# EasyEDA Pro project iamdt-guang-chui-60-40a2c53b.epro, board PCB1
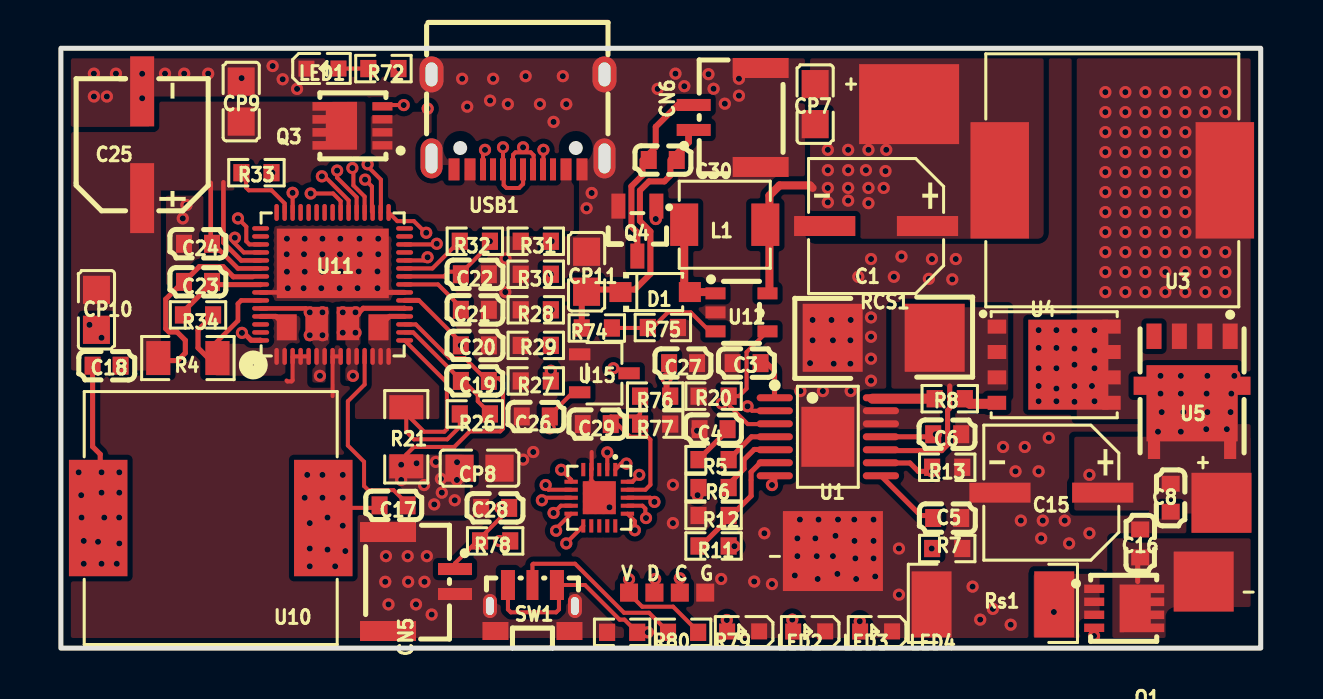
[diagram p3: board, top side]
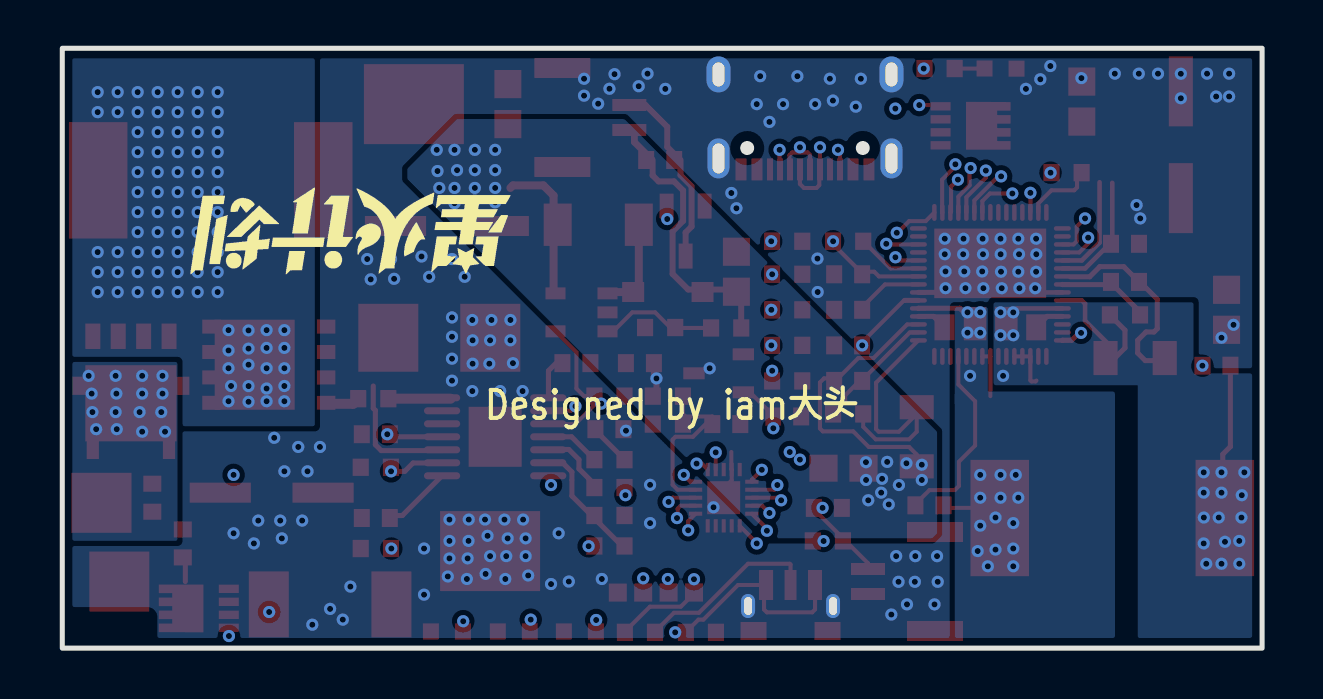
[diagram p4: board, bottom side, seen from below]

Outline 60 x 30 mm; copper layers: Top Layer, Inner1, Inner2, Bottom Layer. Coordinates in mm from the lower left corner of the outline.
Outline path: rectangle 0,30 60,0
Stack: Top Layer 0.035mm 外层铜厚1oz / Dielectric1 0.2104mm 7628 RC49% 8.6mil / Inner1 0.0152mm 内层铜厚 / Dielectric2 1.065mm 1.1mm H/HOZ Copper / Inner2 0.0152mm 内层铜厚 / Dielectric3 0.2104mm 7628 RC49% 8.6mil / Bottom Layer 0.035mm 外层铜厚1oz

## Design rules (mm)
spacing copperThickness1oz (default): track to track 0.102, other pairs 0.152 to 0.3
spacing copperThickness2oz: track to track 0.203, other pairs 0.152 to 0.3
spacing Plane_innerPlane: track to track 0.102, other pairs 0.152 to 0.3
spacing Copper_copperRegion: track to track 0.102, other pairs 0.152 to 0.3
track width copperThickness1oz (default): min 0.127, default 0.254, max 5
track width copperThickness2oz: min 0.203, default 0.254, max 2.54
differential pair differentialPair (default): width min 0.127, default 0.254, max 2.54; gap min 0.152, default 0.152
pour e896 uses Copper_copperRegion
pour e898 uses Copper_copperRegion
pour e900 uses Copper_copperRegion
pour e905 uses Copper_copperRegion
pour e907 uses Copper_copperRegion
pour e909 uses Copper_copperRegion
pour e911 uses Copper_copperRegion
pour e913 uses Copper_copperRegion
pour e915 uses Copper_copperRegion
pour e917 uses Copper_copperRegion
pour e919 uses Copper_copperRegion
pour e921 uses Copper_copperRegion
pour e923 uses Copper_copperRegion
pour e925 uses Copper_copperRegion
pour e927 uses Copper_copperRegion
pour e929 uses Copper_copperRegion
pour e931 uses Copper_copperRegion
pour e933 uses Copper_copperRegion
pour e935 uses Copper_copperRegion
pour e937 uses Copper_copperRegion
pour e939 uses Copper_copperRegion
pour e941 uses Copper_copperRegion
pour e943 uses Copper_copperRegion
pour e945 uses Copper_copperRegion
pour e947 uses Copper_copperRegion
pour e949 uses Copper_copperRegion
pour e951 uses Copper_copperRegion
pour e953 uses Copper_copperRegion
pour e955 uses Copper_copperRegion

## Placement (name value [footprint] x y rotation side)
C  -  [Test-Point-0.5mm]  31.2 2.81 0 top
C1  220uF  [CAP-SMD_BD6.3-L6.6-W6.6-LS7.0-FD]  40.77 21.11 180 top
C3  10uF  [C0603]  34.29 14.25 0 top
C4  1nF  [C0603]  32.64 10.95 0 top
C5  100nF  [C0603]  44.32 6.5 180 top
C6  100nF  [C0603]  44.32 10.7 0 top
C8  100nF  [C0603]  55.5 7.52 90 top
C15  220uF  [CAP-SMD_BD6.3-L6.6-W6.6-LS7.0-FD]  49.53 7.78 180 top
C16  2.2uF  [C0603]  53.98 5.23 270 top
C17  100nF  [C0603]  16.64 7.14 180 top
C18  100nF  [C0603]  2.29 14.12 180 top
C19  1uF  [C0603]  20.7 13.36 0 top
C20  2.2uF  [C0603]  20.7 15.14 180 top
C21  2.2uF  [C0603]  20.7 16.92 180 top
C22  2.2uF  [C0603]  20.7 18.7 180 top
C23  470nF  [C0603]  6.86 18.32 0 top
C24  2.2uF  [C0603]  6.86 20.22 0 top
C25  100uF  [CAP-SMD_BD6.3-L6.5-W6.5-LS7.2-FD]  4.06 25.17 90 top
C26  10uF  [C0603]  23.75 11.59 180 top
C27  10uF  [C0603]  31.11 14.25 0 top
C28  100nF  [C0603]  21.72 7.01 0 top
C29  100nF  [C0603]  26.8 11.2 180 top
C30  10uF  [C0603]  30.1 24.41 180 top
CN5  WAFER-GH1.25-2PLB  [CONN-TH_2P-P1.25_XUNPU_WAFER-GH1.25-2PLB]  18.03 3.33 270 top
CN6  WAFER-GH1.25-2PLB  [CONN-TH_2P-P1.25_XUNPU_WAFER-GH1.25-2PLB]  33.32 26.54 90 top
CP7  22uF  [C0805]  37.72 27.21 90 top
CP8  22uF  [C0805]  20.93 9 180 top
CP9  22uF  [C0805]  9.02 27.33 270 top
CP10  22uF  [C0805]  1.78 16.92 90 top
CP11  22uF  [C0805]  26.29 18.82 270 top
D  -  [Test-Point-0.5mm#3]  29.95 2.54 0 top
D1  B5819W  [SOD-123F_L2.7-W1.6-LS3.8-RD-1]  29.72 17.81 0 top
G  -  [Test-Point-0.5mm#2]  30.81 2.82 0 top
L1  10uH  [IND-SMD_L4.4-W4.2]  33.2 21.17 0 top
LED1  XL-1608UWC-04  [LED0603-RD_WHITE]  13.08 28.98 0 top
LED2  XL-1608UWC-04  [LED0603-RD_WHITE]  34.12 0.83 180 top
LED3  XL-1608UWC-04  [LED0603-RD_WHITE]  37.42 0.83 180 top
LED4  XL-1608UWC-04  [LED0603-RD_WHITE]  40.77 0.83 180 top
NOREF  -  [Pad_e376]  38.61 4.85 90 top
NOREF#2  -  [Pad_e377]  57.15 3.33 0 top
NOREF#3  -  [Pad_e375]  42.42 27.21 270 top
NOREF#4  -  [Pad_e378]  58.04 7.27 0 top
Q1  AON7422E-MS  [POWERDI3333-8_DMN7022LFGQ-7]  52.7 1.99 270 top
Q3  AON7422E-MS  [POWERDI3333-8_DMN7022LFGQ-7]  15.05 26.12 90 top
Q4  MDD3400  [SOT-23-3_L2.9-W1.5-P1.90-LS2.6-BR]  28.83 20.86 90 top
R4  5mΩ  [R1206]  6.35 14.51 180 top
R5  10kΩ  [R0603]  32.64 9.43 0 top
R6  10kΩ  [R0603]  32.64 8.03 180 top
R7  100kΩ  [R0603]  44.32 4.98 180 top
R8  3Ω  [R0603]  44.45 12.47 0 top
R11  200kΩ  [R0603]  32.64 5.11 0 top
R12  9.1kΩ  [R0603]  32.64 6.63 180 top
R13  200kΩ  [R0603]  44.32 9.05 180 top
R20  100kΩ  [R0603]  32.64 12.6 0 top
R21  5mΩ  [R1206]  17.27 10.57 90 top
R26  10Ω  [R0603]  20.7 11.71 180 top
R27  3.6kΩ  [R0603]  23.75 13.36 180 top
R28  18kΩ  [R0603]  23.75 16.92 180 top
R29  9.1kΩ  [R0603]  23.75 15.14 180 top
R30  10kΩ  [R0603]  23.75 18.7 0 top
R31  10kΩ  [R0603]  23.75 20.35 0 top
R32  10kΩ  [R0603]  20.7 20.35 180 top
R33  10kΩ  [R0603]  9.78 23.78 180 top
R34  51Ω  [R0603]  6.86 16.67 0 top
R72  200Ω  [R0603]  16.13 28.98 0 top
R74  100kΩ  [R0603]  26.8 16.01 180 top
R75  10kΩ  [R0603]  30.1 16.03 180 top
R76  200kΩ  [R0603]  29.72 12.6 180 top
R77  100kΩ  [R0603]  29.72 11.2 0 top
R78  10kΩ  [R0603]  21.72 5.36 180 top
R79  10kΩ  [R0603]  31.11 0.79 180 top
R80  100kΩ  [R0603]  28.07 0.79 180 top
RCS1  4mΩ  [RES-SMD_L6.4-W3.2-A]  41.15 15.52 0 top
Rs1  50mΩ  [RES-SMD_L6.4-W3.2-R2512]  46.61 2.19 0 top
SW1  TS36XL-3.5 180gf 072  [SW-TH_SHOU-HAN_TS36XL-3.5]  23.58 2.01 0 top
U1  FP7209mR-G1  [TSSOP-14_L5.0-W4.4-P0.65-LS6.4-BL-EP]  38.35 10.57 270 top
U3  4.7uH  [IND-SMD_L13.5-W12.8]  52.58 23.4 180 top
U4  AONS36306  [PG-TDSON-8_L5.9-W5.2-P1.27-LS6.2-BL-EP]  49.67 14.17 270 top
U5  MBR2045MFST1G  [SO-8FL_L5.2-W5.8-P1.27-LS6.2-BL-EP]  56.57 12.78 180 top
U10  4.7uH  [IND-SMD_L13.5-W12.8]  7.49 6.5 180 top
U11  IP2369  [QFN-7*7-60-5]  13.59 18.19 0 top
U12  LGS6302B5  [SOT-23-5_L3.0-W1.6-P0.95-LS2.8-BL]  34.04 16.79 270 top
U13  PY32F003F16U6TR  [QFN-20_L3.0-W3.0-P0.40-BL-EP1.7]  26.92 7.52 180 top
U15  HT7333  [SOT-23-3_L2.9-W1.6-P1.90-LS2.8-BR]  27.18 13.74 180 top
USB1  TYPE-C 16PIN 2MD(073)  [USB-C-SMD_TYPE-C-6PIN-2MD-073]  22.86 26.32 180 top
V  -  [Test-Point-0.5mm#4]  28.57 2.78 0 top

## Footprints (pads in the part's own frame, mm; a bottom-side part is the same pattern mirrored in y, then rotated)
C0603
  rect 0.8x0.9 smd: 1(-0.7,0) 2(0.7,0)
C0805
  rect 1.41x1.35 smd: 1(-1,0) 2(1,0)
CAP-SMD_BD6.3-L6.5-W6.5-LS7.2-FD
  rect 3.5x1.2 smd: 1(-2.67,0) 2(2.67,0)
CAP-SMD_BD6.3-L6.6-W6.6-LS7.0-FD
  rect 3.06x1 smd: 1(-2.57,0) 2(2.57,0)
CONN-TH_2P-P1.25_XUNPU_WAFER-GH1.25-2PLB
  rect 0.6x1.7 smd: 1(-0.625,1.675) 2(0.625,1.675)
  rect 1x2.8 smd: 3(2.475,-1.675) 4(-2.475,-1.675)
IND-SMD_L4.4-W4.2
  rect 1.4x2.12 smd: 1(2.028,0) 2(-2.028,0)
IND-SMD_L13.5-W12.8
  rect 2.924x5.82 smd: 1(5.628,0) 2(-5.628,0)
LED0603-RD_WHITE
  rect 0.8x0.8 smd: 1(-0.799,-0.004) 2(0.799,0.004)
Pad_e375
  rect 4x5 smd: 1(0,0)
Pad_e376
  rect 4x5 smd: 2(0,0)
Pad_e377
  rect 3x3 smd: 16(0,0)
Pad_e378
  rect 3x3 smd: 17(0,0)
PG-TDSON-8_L5.9-W5.2-P1.27-LS6.2-BL-EP
  rect 0.7x0.925 smd: 1(-1.905,-2.865) 2(-0.635,-2.865) 3(0.635,-2.865) 4(1.905,-2.865) 5(1.905,2.865) 6(0.635,2.865) 7(-0.635,2.865) 8(-1.905,2.865)
  rect 4.5x4 smd: 9(0.001,0.705)
POWERDI3333-8_DMN7022LFGQ-7
  rect 0.42x1 smd: 1(-0.975,-1.025) 2(-0.325,-1.025) 3(0.325,-1.025) 4(0.975,-1.025)
  custom 2.39x2.23 smd: 5(0.005,1.025)
QFN-7*7-60-5
  oval 0.224x0.85 smd: 1(-2.8,-3.6) 2(-2.4,-3.6) 3(-2,-3.6) 4(-1.6,-3.6) 5(-1.2,-3.6) 6(-0.8,-3.6) 7(-0.4,-3.6) 8(0,-3.6) 9(0.4,-3.6) 10(0.8,-3.6) 11(1.2,-3.6) 12(1.6,-3.6) 13(2,-3.6) 14(2.4,-3.6) 15(2.8,-3.6) 31(2.8,3.6) 32(2.4,3.6) 33(2,3.6) 34(1.6,3.6) 35(1.2,3.6) 36(0.8,3.6) 37(0.4,3.6) 38(0,3.6) 39(-0.4,3.6) 40(-0.8,3.6) 41(-1.2,3.6) 42(-1.6,3.6) 43(-2,3.6) 44(-2.4,3.6) 45(-2.8,3.6)
  oval 0.85x0.224 smd: 16(3.6,-2.8) 17(3.6,-2.4) 18(3.6,-2) 19(3.6,-1.6) 20(3.6,-1.2) 21(3.6,-0.8) 22(3.6,-0.4) 23(3.6,0) 24(3.6,0.4) 25(3.6,0.8) 26(3.6,1.2) 27(3.6,1.6) 28(3.6,2) 29(3.6,2.4) 30(3.6,2.8) 46(-3.6,2.8) 47(-3.6,2.4) 48(-3.6,2) 49(-3.6,1.6) 50(-3.6,1.2) 51(-3.6,0.8) 52(-3.6,0.4) 53(-3.6,0) 54(-3.6,-0.4) 55(-3.6,-0.8) 56(-3.6,-1.2) 57(-3.6,-1.6) 58(-3.6,-2) 59(-3.6,-2.4) 60(-3.6,-2.8)
  rect 1x1.3 smd: 61(-2.293,-2.146) 64(2.295,-2.144)
  rect 1.125x1.672 smd: 62(-0.797,-1.958) 63(0.764,-1.956)
  rect 5.6x3.478 smd: 65(0.006,1.053)
QFN-20_L3.0-W3.0-P0.40-BL-EP1.7
  rect 0.2x0.665 smd: 1(-0.8,-1.407) 2(-0.4,-1.407) 3(0,-1.407) 4(0.4,-1.407) 5(0.8,-1.407) 11(0.8,1.407) 12(0.4,1.407) 13(0,1.407) 14(-0.4,1.407) 15(-0.8,1.407)
  rect 0.665x0.2 smd: 6(1.407,-0.8) 7(1.407,-0.4) 8(1.407,0) 9(1.407,0.4) 10(1.407,0.8) 16(-1.407,0.8) 17(-1.407,0.4) 18(-1.407,0) 19(-1.407,-0.4) 20(-1.407,-0.8)
  rect 1.65x1.65 smd: 21(0,0)
R0603
  rect 0.806x0.864 smd: 1(-0.753,0) 2(0.753,0)
R1206
  rect 1.208x1.701 smd: 1(-1.479,0) 2(1.479,0)
RES-SMD_L6.4-W3.2-A
  rect 3x3.4 smd: 1(-2.55,0) 2(2.55,0)
RES-SMD_L6.4-W3.2-R2512
  rect 2x3.3 smd: 1(-3.067,0) 2(3.067,0)
SO-8FL_L5.2-W5.8-P1.27-LS6.2-BL-EP
  rect 0.75x1.27 smd: 1(-1.905,-2.816) 2(-0.635,-2.816) 3(0.635,-2.816) 4(1.905,-2.816)
  rect 0.61x1.016 smd: 5(1.905,2.816) 6(-1.905,2.816)
  rect 1.016x0.91 smd: 7(2.413,-0.339) 8(-2.413,-0.339)
  rect 4.56x3.81 smd: 8(0,0.537)
SOD-123F_L2.7-W1.6-LS3.8-RD-1
  rect 1.1x1 smd: 1(-1.735,0) 2(1.735,0)
SOT-23-3_L2.9-W1.5-P1.90-LS2.6-BR
  rect 1.25x0.7 smd: 1(1.25,-0.95) 2(1.25,0.95) 3(-1.25,0)
SOT-23-3_L2.9-W1.6-P1.90-LS2.8-BR
  rect 1.07x0.6 smd: 1(1.235,-0.95) 2(1.235,0.95) 3(-1.235,0)
SOT-23-5_L3.0-W1.6-P0.95-LS2.8-BL
  rect 0.6x1 smd: 1(-0.95,-1.3) 2(0,-1.3) 3(0.95,-1.3) 4(0.95,1.3) 5(-0.95,1.3)
SW-TH_SHOU-HAN_TS36XL-3.5
  rect 0.7x1.5 smd: 1(-1.225,1.15) 3(1.225,1.15)
  rect 0.6x1.5 smd: 2(0,1.15)
  rect 1.3x0.9 smd: 4(1.85,-1.15) 5(-1.85,-1.15)
  oval 0.7x1.2 hole 0.4x0.9: 6(2.125,0.1) 7(-2.125,0.1)
Test-Point-0.5mm
  rect 0.9x0.9 smd: 1(-0.252,-0.033)
Test-Point-0.5mm#2
  rect 0.9x0.9 smd: 1(1.415,-0.049)
Test-Point-0.5mm#3
  rect 0.9x0.9 smd: 1(-0.268,0.237)
Test-Point-0.5mm#4
  rect 0.9x0.9 smd: 1(-0.157,0)
TSSOP-14_L5.0-W4.4-P0.65-LS6.4-BL-EP
  oval 0.35x1.809 smd: 1(-1.95,-2.655) 2(-1.3,-2.655) 3(-0.65,-2.655) 4(0,-2.655) 5(0.65,-2.655) 6(1.3,-2.655) 7(1.95,-2.655) 8(1.95,2.655) 9(1.3,2.655) 10(0.65,2.655) 11(0,2.655) 12(-0.65,2.655) 13(-1.3,2.655) 14(-1.95,2.655)
  rect 3x2.65 smd: 15(0,0)
USB-C-SMD_TYPE-C-6PIN-2MD-073
  rect 0.55x1.1 smd: 1(-3.2,2.375) 2(-2.4,2.375) 11(2.4,2.375) 12(3.2,2.375)
  rect 0.3x1.1 smd: 3(-1.75,2.375) 4(-1.25,2.375) 5(-0.75,2.375) 6(-0.25,2.375) 7(0.25,2.375) 8(0.75,2.375) 9(1.25,2.375) 10(1.75,2.375)
  oval 1.1x2 hole 0.6x1.5: 13(-4.325,1.825) 14(4.325,1.825)
  oval 1.2x1.8 hole 0.6x1.2: 13(-4.325,-2.375) 14(4.325,-2.375)

## Nets
As in the schematic, except:
GND: C1.2 C3.1 C4.1 C5.1 C6.2 C8.1 C15.2 C16.1 C20.1 C21.1 C22.1 C24.1 C25.2 C26.2 C27.2 C28.1 C29.2 CN5.2 CN5.3 CN5.4 CN6.3 CN6.4 CP7.1 CP8.1 CP9.1 CP10.1 CP11.1 G.1 LED1.1 LED2.1 LED3.1 LED4.1 NOREF.2 Q4.2 R7.1 R12.2 R13.1 R20.1 R27.2 R28.2 R29.2 R30.1 R31.1 R75.1 R77.2 R80.2 RCS1.1 Rs1.1 SW1.4 SW1.5 SW1.6 SW1.7 U1.12 U1.13 U1.15 U11.3 U11.4 U11.5 U11.8 U11.9 U11.22 U11.54 U11.65 U12.2 U13.4 U13.21 U15.1 USB1.1 USB1.12 USB1.13 USB1.14
VCC: C1.1 C19.2 C20.2 C27.1 CP7.2 CP8.2 L1.1 NOREF#3.1 R21.1 R76.1 U3.1 U11.18 U11.21 U12.5 U15.3
OUT+: C6.1 C8.2 C15.1 NOREF#4.17 R11.2 U1.11 U5.5 U5.6 U5.7 U5.8
OUT-: C16.2 NOREF#2.16 Q1.5

Pads without a net: U5 4; U11 27 29 30 38 39 40 41 42 45 46 47 58 59; U13 3 5 12 13 14 15; USB1 3 9

## Via types
v1: diameter 0.61, hole 0.305, Top Layer to Bottom Layer, 374 vias

## Routing (per net, layer and track width the routed paths; a pad name or vN(x,y) marks a point on that pad's centre or on a via; arc(x,y) is an arc through that point)
GND: length 15.6
  Top Layer w0.2: 13.59,14.59 13.59,12.6
  Top Layer w0.203: 13.59,14.59 13.99,14.59 ; 12.39,14.59 11.59,14.59 11.59,13.39 11.53,13.34 11.33,13.34 11.29,13.38 ; U13.21 26.92,7.99 26.52,8.39 U13.4 26.54,8.95 26.54,9.81
  Top Layer w0.23: U11.54 12.14,17.79 U11.65
  Top Layer w0.254: U11.65 v1(14,18.84) 15.05,17.79 U11.22
  vias: v1(1.43,16.17) v1(1.65,28.73) v1(1.65,27.59) v1(2.03,15.52) v1(2.3,27.59) v1(2.75,28.73) v1(4.06,28.72) v1(4.06,27.5) v1(5.21,28.73) v1(6.1,21.49) v1(6.17,28.73) v1(6.28,22.16) v1(7.37,28.73) v1(9.04,28.51) v1(10.59,29.11) v1(11.09,28.45) v1(11.3,20.48) v1(11.29,19.7) v1(11.3,18.82) v1(11.35,18) v1(11.81,27.97) v1(12.19,20.48) v1(12.16,19.7) v1(12.19,18.82) v1(12.14,18) v1(13.02,18) v1(13.08,20.48) v1(13.08,19.7) v1(13.06,18.82) v1(13.98,20.48) v1(13.96,19.7) v1(13.94,18) v1(14.93,20.48) v1(14.9,18.84) v1(14.83,18) v1(14.95,19.7) v1(15.87,20.48) v1(15.87,19.7) v1(15.83,18.84) v1(15.83,18) v1(16.22,3.32) v1(16.26,4.6) v1(16.38,2.19) v1(17.34,4.6) v1(17.37,3.32) v1(17.76,2.19) v1(18.18,3.32) v1(18.3,4.6) v1(18.54,1.68) v1(20.07,28.48) v1(20.32,27.08) v1(21.46,27.38) v1(21.61,28.48) v1(22.23,17.81) v1(22.24,19.48) v1(22.35,27.21) v1(23.11,9.43) v1(23.24,28.6) v1(23.62,9.81) v1(23.96,27.21) v1(24.64,26.32) v1(25.1,28.6) v1(25.27,27.21) v1(26.29,22) v1(26.54,22.76) v1(27.43,7.04) v1(29.85,27.97) v1(30.61,8.17) v1(30.61,6.25) v1(30.73,28.73) v1(31.18,28.1) v1(31.81,10.87) v1(32.39,28.7) v1(32.64,27.98) v1(33.02,3.46) v1(33.2,27.23) v1(33.91,28.48) v1(33.91,27.63) v1(34.67,3.33) v1(35.18,5.74) v1(35.56,3.2) v1(36.7,3.63) v1(36.83,5.49) v1(36.83,4.6) v1(36.98,12.86) v1(36.96,6.43) v1(37.46,14.25) v1(37.59,16.41) v1(37.59,15.39) v1(37.73,5.49) v1(37.8,4.6) v1(37.89,6.43) v1(37.85,3.46) v1(38.11,12.86) v1(38.54,16.41) v1(38.61,15.39) v1(38.61,4.6) v1(38.65,14.22) v1(38.73,5.62) v1(38.83,3.71) v1(38.86,6.43) v1(39.5,16.41) v1(39.48,15.39) v1(39.48,14.22) v1(39.5,12.86) v1(39.67,6.43) v1(39.69,5.36) v1(39.73,4.49) v1(39.77,3.46) v1(39.88,18.57) v1(40.51,19.46) v1(40.51,16.54) v1(40.51,15.57) v1(40.51,14.47) v1(40.51,13.38) v1(40.64,6.43) v1(40.64,5.36) v1(40.64,4.49) v1(40.72,3.58) v1(41.66,18.57) v1(41.91,4.98) v1(41.91,2.67) v1(42.04,19.59) v1(43.41,18.47) v1(43.56,19.46) v1(44.58,18.44) v1(44.75,19.46) v1(45.59,3.08) v1(45.97,1.42) v1(46.61,1.96) v1(47.12,10.06) v1(47.5,1.17) v1(47.74,8.84) v1(48.01,6.38) v1(48.2,10.06) v1(48.89,8.84) v1(49.02,5.49) v1(49.1,6.38) v1(49.4,10.52) v1(50.2,6.38) v1(50.42,5.23) v1(51.43,5.74)
VCC: length 48.4
  Top Layer w0.203: U11.18 17.75,16.19 19.43,14.51 20.19,14.51 21.21,13.49 21.91,13.49 22.11,13.29 22.11,10.98 21.97,10.84 20.45,10.84 19.67,10.06 17.65,10.06 17.27,9.68 R21.1 ; 20,15.27 20,15.3 17.91,17.39 17.87,17.39
  Top Layer w0.254: 17.87,17.39 17.19,17.39
  Top Layer w0.3: 30.47,12.73 30.29,12.91 v1(30.29,13.49) 30.42,13.61 C27.1
  Top Layer w0.4: 37.59,23.02 37.46,23.14 35.94,23.14 35.43,22.63 35.43,17.84 U12.5
  Inner2 w0.2: v1(20,15.14) 23.24,15.14 24.13,16.03 32.09,16.03 v1(38.35,22.29)
  vias: v1(17.02,9.17) v1(17.02,8.41) v1(17.79,9.24) v1(18.16,8.16) v1(18.67,7.19) v1(18.75,9.31) v1(19.01,8.47) v1(19.05,7.78) v1(19.7,7.39) v1(19.81,9.3) v1(19.81,8.41) v1(27.63,14) v1(38.35,24.92) v1(38.35,23.9) v1(38.35,23.02) v1(39.37,24.92) v1(39.37,23.9) v1(39.37,23.02) v1(39.37,22.38) v1(40.26,23.9) v1(40.39,24.92) v1(40.39,23.02) v1(40.39,22.25) v1(41.15,23.02) v1(41.27,24.92) v1(41.24,23.86)
7209DIM: length 10.3
  Top Layer w0.203: v1(34.34,12.09) 34.56,11.87 U1.2 ; U13.2 v1(27.32,9.79)
  Inner1 w0.203: v1(27.32,9.79) 32.03,9.79 v1(34.34,12.09)
7209EN: length 19
  Top Layer w0.203: R20.2 33.91,12.6 34.29,12.98 34.29,14.8 35.33,15.84 U12.4 ; v1(33.05,12.23) 33.05,12.32 33.24,12.32 34.35,11.2 35.08,11.2 ; U13.1 28.02,9.23 v1(28.28,9.23)
  Inner1 w0.203: v1(33.05,12.23) 33.05,12.38 33.66,12.98 34.62,12.98 35.31,12.3 35.31,12.09 32.44,9.23 v1(28.28,9.23)
OUT+: length 33.2
  Top Layer w0.254: 40.94,10.57 43.62,10.57 v1(43.75,10.7)
  Inner1 w0.3: v1(51.43,8.66) 51.31,8.66 50.67,8.03 46.42,8.03 v1(43.75,10.7)
  Inner2 w0.254: v1(33.68,5.1) 33.68,7.55 35.56,9.43 50.67,9.43 v1(51.43,8.66)
  vias: v1(54.86,10.82) v1(54.99,13.62) v1(54.99,12.73) v1(55.05,11.8) v1(56.01,13.62) v1(56.01,12.73) v1(56.01,10.82) v1(56.14,11.8) v1(57.3,12.73) v1(57.28,10.95) v1(57.33,13.62) v1(57.33,11.8) v1(58.31,10.95) v1(58.53,12.73) v1(58.49,11.8) v1(58.68,13.62)
OUT-: length 1.3
  Top Layer w0.254: 53.85,4.66 53.85,3.33
$1N264: length 1.9
  Top Layer w0.254: U1.1 35.69,12.53 35.69,13.87 35.31,14.25
$1N387: length 3.7
  Top Layer w0.254: 33.14,9.43 R5.2 34.54,10.57 36.33,10.57
$1N564: length 10.3
  Top Layer w0.254: v1(35.56,8.16) 35.67,8.16 35.7,8.19 U1.7
  Inner2 w0.254: v1(43.55,4.98) 43.55,5.76 41.66,7.65 36.07,7.65 v1(35.56,8.16)
$1N2154: length 4.1
  Top Layer w0.254: 36.35,9.93 34.67,9.93 34.16,9.43 34.16,8.97 33.39,8.2 R6.1
$1N13969: length 6.4
  Top Layer w0.254: 44.45,13.11 44.45,12 44.34,11.89 44.34,10.17 44.05,9.88 41.01,9.88
$1N14432: length 15
  Top Layer w0.254: 40.39,9.26 42.46,9.26 42.88,8.84 v1(43.56,8.84)
  Inner1 w0.254: v1(43.56,8.84) 43.56,8.71 49.88,2.39 49.9,2.39 50.24,2.05 50.24,2.03 v1(51.67,0.61)
$1N15489: length 3.5
  Top Layer w0.254: U1.8 43,6.63 43.5,6.63 C5.2
$1N15599: length 2.1
  Top Layer w0.254: C4.2 33.26,10.87 33.26,10.81 31.88,9.43 R5.1
$1N17354: length 1.7
  Top Layer w0.5: R8.2 45.46,12.22 46.76,12.22 U4.4
$1N17355: length 3.2
  Top Layer w0.5: 43.82,12.47 R8.1 40.58,12.47
$1N20761: length 6.7
  Top Layer w0.254: 34.52,8.43 34.52,8.81 35.01,9.3 36.36,9.3 ; 34.52,8.38 34.52,7.61 32.01,5.11
$1N28212: length 20.2
  Inner1 w0.254: v1(31.84,7.65) 31.97,7.52 43.94,7.52 v1(49.66,1.81)
$1N29777:
  vias: v1(48.89,15.9) v1(48.89,15.01) v1(48.89,14) v1(48.89,13.11) v1(48.89,12.35) v1(49.78,15.9) v1(49.78,15.01) v1(49.78,14) v1(49.78,12.98) v1(49.78,12.35) v1(50.69,15.89) v1(50.69,14.98) v1(50.69,14.17) v1(50.69,13.11) v1(50.69,12.32) v1(51.56,13.11) v1(51.69,15.9) v1(51.69,14.89) v1(51.69,14) v1(51.69,12.35) v1(52.23,27.81) v1(52.23,26.81) v1(52.23,25.81) v1(52.23,24.81) v1(52.23,23.81) v1(52.23,22.81) v1(52.23,21.81) v1(52.23,20.81) v1(52.23,19.81) v1(52.23,18.81) v1(52.23,17.81) v1(53.23,27.81) v1(53.23,26.81) v1(53.23,25.81) v1(53.23,24.81) v1(53.23,23.81) v1(53.23,22.81) v1(53.23,21.81) v1(53.23,20.81) v1(53.23,19.81) v1(53.23,18.81) v1(53.23,17.81) v1(54.23,27.81) v1(54.23,26.81) v1(54.23,25.81) v1(54.23,24.81) v1(54.23,23.81) v1(54.23,22.81) v1(54.23,21.81) v1(54.23,20.81) v1(54.23,19.81) v1(54.23,18.81) v1(54.23,17.81) v1(55.23,27.81) v1(55.23,26.81) v1(55.23,25.81) v1(55.23,24.81) v1(55.23,23.81) v1(55.23,22.81) v1(55.23,21.81) v1(55.23,20.81) v1(55.23,19.81) v1(55.23,18.81) v1(55.23,17.81) v1(56.23,27.81) v1(56.23,26.81) v1(56.23,25.81) v1(56.23,24.81) v1(56.23,23.81) v1(56.23,22.81) v1(56.23,21.81) v1(56.23,20.81) v1(56.23,19.81) v1(56.23,18.81) v1(56.23,17.81) v1(57.23,27.81) v1(57.23,26.81) v1(57.23,19.81) v1(57.23,18.81) v1(57.23,17.81) v1(58.23,27.81) v1(58.23,26.81) v1(58.23,19.81) v1(58.23,18.81) v1(58.23,17.81)
$1N32185: length 18.2
  Top Layer w0.203: v1(24.13,24.92) 24.13,23.84 24.11,23.81 ; v1(12.49,22.74) 13.61,22.74 13.99,22.36 U11.37
  Inner2 w0.203: v1(12.49,22.74) 12.49,24.71 14.05,26.27 22.78,26.27 v1(24.13,24.92)
$1N32191: length 12
  Top Layer w0.203: v1(14.58,24.01) 14.63,23.96 14.63,23.14 15.19,22.58 U11.34 ; v1(21.21,24.92) 21.11,24.82 21.11,23.81
  Inner1 w0.203: v1(14.58,24.01) 14.58,24.38 16.13,25.94 20.7,25.94 21.21,25.43 v1(21.21,24.92)
$1N32198: length 16.6
  Top Layer w0.203: U11.35 14.79,22.55 13.82,23.52 v1(13.82,23.88) ; v1(22.11,25.05) 22.11,23.81 22.14,23.78 22.14,23.16 22.29,23.01 22.91,23.01 23.11,23.21 23.11,23.81 23.11,23.81
  Inner1 w0.203: v1(13.82,23.88) 13.82,24.77 15.48,26.42 20.73,26.42 v1(22.11,25.05)
$1N32204: length 17.3
  Top Layer w0.203: v1(13.05,23.59) 13.19,23.59 14.39,22.39 U11.36 ; 23.61,23.81 23.64,23.84 23.64,24.65 23.49,24.79 22.73,24.79 22.61,24.67 22.61,23.81
  Inner2 w0.203: v1(23.11,25.05) 22.22,25.94 14.35,25.94 13.05,24.64 v1(13.05,23.59)
$1N32461: length 7.8
  Top Layer w0.254: 9.99,15.39 9.98,15.4 9.51,15.4 9.15,15.77 v1(9.05,15.77)
  Inner1 w0.254: v1(2.99,14.12) 7.41,14.12 v1(9.05,15.77)
$1N32472: length 9.9
  Top Layer w0.2: 17.34,7.01 17.34,7.2 16.64,7.9 15.37,7.9 15.16,8.11 15.16,9.32 14.35,10.13 14.35,12.35 15.19,13.19 15.19,14.59
$1N32816: length 6.1
  Top Layer w0.203: R26.1 21.45,11.74 20.85,12.35 20.85,12.64 20,13.49 19.92,13.49 17.62,15.79 U11.17
$1N33011: length 3.3
  Top Layer w0.203: 20,17.05 18.86,18.19 U11.23
$1N33016: length 18.7
  Top Layer w0.203: 17.19,18.59 19.16,18.59 19.4,18.82 20,18.82 ; C22.2 20,18.75 21.45,20.2 v1(21.45,20.35)
  Inner1 w0.203: v1(10.58,23.78) 10.58,22.6 11.44,21.74 20.96,21.74 21.45,21.25 v1(21.45,20.35)
$1N33115: length 9.7
  Top Layer w0.203: v1(18.34,19.55) 18.18,19.39 17.19,19.39
  Inner1 w0.203: v1(18.34,19.55) 24.01,13.87 v1(24.5,13.87)
$1N33198: length 10.2
  Top Layer w0.203: U11.31 16.82,21.35 17.65,21.35 18.24,20.77 v1(18.27,20.77)
  Inner1 w0.203: v1(18.27,20.77) 18.56,20.77 18.56,20.78 19.03,20.78 19.04,20.77 20.15,20.77 24,16.92 v1(24.54,16.92)
$1N33293: length 9.5
  Top Layer w0.203: v1(18.8,20.22) 18.76,20.19 U11.28
  Inner1 w0.203: v1(24.54,15.14) 23.88,15.14 v1(18.8,20.22)
$1N33353: length 18.5
  Top Layer w0.203: U11.32 16,21.8 16,23.43 15.34,24.09 v1(15.34,24.2)
  Inner1 w0.203: v1(15.34,24.2) 15.58,23.95 16.59,23.95 17.89,22.65 21.41,22.65 23.16,20.91 24.78,20.91 25.11,20.58 25.11,20.12 24.78,19.79 24.32,19.79 24.06,20.04 23.16,20.04 v1(24.5,18.7)
$1N33459: length 12.4
  Top Layer w0.203: v1(15.21,23.43) 15.55,23.09 15.55,21.82 15.59,21.79
  Inner1 w0.203: v1(15.21,23.43) 16.68,23.43 17.76,22.35 21.28,22.35 23.28,20.35 v1(24.55,20.35)
$1N33582: length 3.3
  Top Layer w0.203: U11.25 18.58,18.99 19.94,20.35 R32.2
$1N33603: length 3.5
  Top Layer w0.203: R33.2 9.25,23.55 9.25,23.04 9.4,22.9 10.53,22.9 11.19,22.24 11.19,21.79
$1N33920: length 1.5
  Top Layer w0.203: R72.1 13.88,28.98 LED1.2
$1N33955: length 10.1
  Top Layer w0.203: U11.43 11.59,22.77
  Inner1 w0.203: v1(16.92,28.98) 16.92,28.71 16,27.79 14.83,27.79 11.59,24.54 v1(11.59,22.77)
$1N34076: length 4.6
  Top Layer w0.254: 5.97,16.73 6.02,16.73 7.47,18.18 9.98,18.18 U11.53
$1N34291: length 16.6
  Top Layer w0.203: v1(8.7,20.53) 8.64,20.46 8.64,20.3 9.14,19.79 U11.49 ; 16.16,27.16 v1(17.14,27.16)
  Inner2 w0.203: v1(8.7,20.53) 8.13,21.1 8.13,23.65 11.64,27.16 v1(17.14,27.16)
$1N34301: length 14.7
  Top Layer w0.203: v1(8.86,21.49) 9.27,21.08 9.27,20.35 9.43,20.19 U11.48
  Inner2 w0.203: v1(18.34,26.98) 17.96,26.6 12.48,26.6 9.38,23.51 9.38,22.02 v1(8.86,21.49)
$1N34904: length 21.5
  Top Layer w0.23: U11.51 8.85,18.99 7.49,20.35 7.49,23.27 ; 8.13,23.3 8.13,20.28 9.02,19.39 9.99,19.39
  Top Layer w0.254: 9.59,18.57 8.62,18.57 8.12,19.08 6.92,19.08 5.97,18.13 5.92,18.13 5.24,17.45 5.24,15.97 5.41,15.81 5.81,15.81 6.22,15.39 6.22,14.76 5.84,14.38 4.87,14.38 4.74,14.51
$1N34934: length 14.3
  Top Layer w0.2: R21.2 17.27,11.71 ; 17.27,11.71 18.16,10.82 19.18,10.82 19.3,10.95 ; 17.27,11.71 17.27,10.82 17.65,10.44 19.32,10.44 19.95,11.07 R26.2
  Top Layer w0.203: 19.3,10.95 19.3,13.27 17.19,15.39
  Top Layer w0.254: U11.64 16.43,16.59 17.19,16.59
$1N34942: length 6.1
  Top Layer w0.2: 15.94,7.01 13.71,7.01 13.22,6.53
  Top Layer w0.254: U11.63 15.12,17 17.18,17 U11.20
  vias: v1(12.19,7.52) v1(12.32,8.66) v1(12.45,6.25) v1(12.45,4.98) v1(12.45,4.09) v1(13.08,8.66) v1(13.08,7.52) v1(13.33,6.53) v1(13.33,4.93) v1(13.72,4.09) v1(14.1,16.79) v1(14.1,15.78) v1(14.1,8.66) v1(14.1,7.52) v1(14.1,6.12) v1(14.22,4.85) v1(14.61,13.62) v1(14.73,16.79) v1(14.73,15.78)
$1N34952: length 9.1
  Top Layer w0.23: 7.7,14.51 7.7,15.22 8.85,16.38 8.85,17.23 9.02,17.39 9.99,17.39
  Top Layer w0.254: 7.75,16.67 7.63,16.67 6.86,15.9 6.86,15.01 7.37,14.51 7.7,14.51 ; U11.61 10.75,16.59 9.99,16.59
$1N34960: length 10.3
  Top Layer w0.23: v1(12.45,16.79) 12.25,16.99 U11.56
  Top Layer w0.254: 1.97,6.53 1.97,9.69 1.59,10.08 C18.2
  vias: v1(0.89,8.79) v1(1.02,7.65) v1(1.03,6.53) v1(1.14,5.36) v1(1.14,4.22) v1(1.86,5.32) v1(2.03,8.79) v1(2.03,7.78) v1(2.03,4.22) v1(2.17,6.53) v1(2.79,4.22) v1(2.92,8.79) v1(2.92,7.78) v1(2.91,6.53) v1(2.92,5.23) v1(12.45,15.65) v1(12.95,13.62) v1(13.08,16.79) v1(13.08,15.65)
$1N37163: length 5
  Top Layer w0.4: L1.2 31.17,17.81 32.67,17.81 U12.1
$1N37271: length 14
  Top Layer w0.3: 26.05,16.39 26.05,17.69 26.29,17.94 28.7,17.94 29.48,18.71 29.48,20.84 28.96,21.36 28.96,22.89 29.41,23.34 30.18,23.34 30.48,23.64 30.48,24.41
  Top Layer w0.34: 31.39,25.91 31.39,25.31 30.55,24.46 30.55,24.41
$1N37490: length 5.9
  Top Layer w0.203: R74.1 29.33,16.01 R75.2 29.6,16.03 30.35,16.79 31.5,16.79 32.45,15.84 U12.3
$1N44107: length 21.8
  Top Layer w0.203: C26.1 24.45,11.64 25.62,12.81 ; v1(25.02,8.92) 25.52,8.42 U13.6 ; R79.1 31.87,0.82 30.61,2.07 29.07,2.07 28.37,2.78
  Inner1 w0.4: v1(24.44,11) 25.02,10.42 v1(25.02,8.92) 23.75,8.92 22.99,8.16 22.99,3.58 23.37,3.2 28.17,3.2 v1(28.41,3.44)
$1N44580: length 8.5
  Top Layer w0.203: 29.21,12.56 28.96,12.32 28.96,11.71 28.84,11.59 27.5,11.59 27.5,11.53 28.46,10.57 29.34,10.57 29.48,10.43 29.48,8.17 29.23,7.92 U13.19
$1N45278: length 9.3
  Top Layer w0.203: SW1.2 23.58,4.18 23.62,4.22 25.71,4.22 28.16,1.77 29.41,1.77 30.36,0.82 R79.2
$1N45302: length 18.8
  Top Layer w0.203: 28.7,6 28.7,6.35 U13.16 ; R80.1 28.19,1.42 27.94,1.42 26.21,3.16 SW1.3 24.91,3.05 24.91,1.93 24.77,1.79 22.5,1.79 22.36,1.93 SW1.1
  Inner1 w0.203: v1(29.35,0.79) 29.67,0.79 31.62,2.75 31.62,3.61 29.34,5.89 v1(28.7,5.89)
$1N47945: length 12.1
  Top Layer w0.2: v1(24.24,8.16) 24.24,8.06 24.38,7.92 U13.7
  Inner1 w0.203: v1(29.72,3.46) 29.08,4.09 24.13,4.09 23.49,4.73 23.49,7.78 23.88,8.16 v1(24.24,8.16)
$1N47951: length 11.4
  Top Layer w0.203: U13.8 24.18,7.52 v1(24.05,7.39)
  Inner1 w0.203: 30.95,3.49 29.85,4.6 24.64,4.6 24,5.23 24,7.34 v1(24.05,7.39)
  vias: v1(30.95,3.49)
$1N48261: length 13.3
  Top Layer w0.203: 28.33,7.12 29.08,7.12 29.23,6.98 29.23,6.54 v1(29.26,6.5)
  Inner2 w0.203: v1(21.93,5.36) 21.94,5.35 22.84,5.35 22.99,5.49 22.99,7.9 24.77,9.68 26.09,9.68 v1(29.26,6.5)
$1N48268: length 15.8
  Top Layer w0.203: U13.18 29.47,7.52 v1(29.68,7.31) ; 22.42,7.01 22.42,6.95 19.71,4.24 CN5.1
  Inner2 w0.203: v1(21.98,7.02) 22.68,7.72 22.68,8.03 24.64,9.98 26.21,9.98 28.89,7.31 v1(29.68,7.31)
$1N48317: length 16.8
  Top Layer w0.203: U13.20 28.58,8.32 v1(28.92,8.66)
  Inner1 w0.203: v1(28.92,8.66) 27.3,8.66 26.54,9.43 26.54,17.81 29.75,21.01 v1(29.75,21.46)
$1N48444: length 11.8
  Top Layer w0.203: v1(25.27,5.23) 25.27,5.26 U13.11
  Inner2 w0.203: v1(33.3,1.41) 32.67,2.04 26.87,2.04 25.27,3.64 v1(25.27,5.23)
$1N48451: length 16
  Top Layer w0.203: U13.10 24.77,5.97 v1(24.77,5.87)
  Inner2 w0.203: v1(24.77,5.87) 25.53,5.87 25.91,5.49 25.91,3.46 26.92,2.44 33.15,2.44 34.16,1.42 v1(36.58,1.42)
$1N48458: length 19.9
  Top Layer w0.203: U13.9 25,7.12 v1(24.64,6.76)
  Inner2 w0.203: v1(24.64,6.76) 25.02,6.38 25.65,6.38 26.29,5.74 26.29,3.58 27.13,2.75 33.27,2.75 33.96,2.06 39.24,2.06 39.95,1.35 v1(39.95,1.34)
$1N55823: length 8.9
  Top Layer w0.3: 28.83,19.86 28.83,20.79 28.53,21.08 28.53,23.1 29.08,23.65 29.08,24.41 ; 29.14,24.41 29.14,24.46 29.75,25.06 29.75,26.07 30.84,27.16 31.39,27.16

## Copper pours and planes (outline as drawn; the poured copper is in the pictures)
GND on Top Layer: -0.76,33.18 -0.75,33.29 -0.7,33.42 -0.62,33.54 -0.5,33.62 -0.37,33.67 -0.26,33.68 61.22,33.68 61.33,33.67 61.46,33.62 61.58,33.54 61.66,33.42 61.71,33.29 61.72,33.18 61.72,0.27 61.71,0.17 61.66,0.03 61.58,-0.08 61.46,-0.16 61.33,-0.21 61.22,-0.23 -0.26,-0.23 -0.37,-0.21 -0.5,-0.16 -0.62,-0.08 -0.7,0.03 -0.75,0.17 -0.76,0.27
GND on Bottom Layer: -2.29,32.41 61.47,32.41 61.47,-2.13 -2.29,-2.13
GND on Inner1: -1.91,31.65 61.47,31.65 61.47,-1.5 -1.91,-1.5
GND on Inner2: -1.4,32.54 62.36,32.54 62.36,-1.75 -1.4,-1.75
VCC on Top Layer: 37.46,29.95 37.47,30.02 37.52,30.12 37.6,30.2 37.7,30.25 37.77,30.25 48.85,30.25 48.92,30.25 49.02,30.2 49.1,30.12 49.14,30.02 49.15,29.95 49.15,20.78 49.14,20.71 49.1,20.61 49.02,20.53 48.92,20.48 48.85,20.48 37.77,20.48 37.7,20.48 37.6,20.53 37.52,20.61 37.47,20.71 37.46,20.78
VCC on Top Layer: 16.38,9.68 20.19,9.68 20.19,6.63 16.38,6.63
VCC on Bottom Layer: 16.26,10.82 16.26,5.74 16.51,5.49 24.77,5.49 42.75,23.47 42.75,23.98 40.27,26.46 31.89,26.46
OUT+ on Top Layer: 54.42,13.43 60.13,13.43 60.13,6.73 54.42,6.73
OUT+ on Top Layer: 50.67,10.57 59.82,10.57 59.82,6.89 50.67,6.89
OUT+ on Bottom Layer: 54.25,14.31 59.69,14.31 59.69,5.36 54.25,5.36
OUT- on Top Layer: 52.58,5.49 59.56,5.49 59.56,-1.88 52.58,-1.88
$1N13969 on Top Layer: 41.53,17.05 47.37,17.05 47.37,12.6 41.53,12.6
$1N28212 on Top Layer: 48.64,3.71 51.94,3.71 51.94,0.28 48.64,0.28
$1N29777 on Top Layer: 50.8,29.62 59.82,29.62 59.82,11.46 50.8,11.46
$1N29777 on Bottom Layer: 47.37,30.25 59.65,30.25 59.65,11.1 47.37,11.1
$1N34301 on Top Layer: 16.38,23.9 25.65,23.9 25.65,20.86 16.38,20.86
$1N34301 on Top Layer: 13.46,26.83 18.54,26.83 18.54,22.51 13.46,22.51
$1N34904 on Top Layer: 4.7,27.33 15.24,27.33 15.24,22.89 4.7,22.89
$1N34904 on Top Layer: 0.51,25.81 5,25.81 5,13.88 0.51,13.88
$1N34934 on Top Layer: 15.37,16.67 16.51,16.67 16.51,14.12 15.37,14.12
$1N34934 on Top Layer: 15.37,15.1 15.37,13.36 14.35,12.35 14.35,11.46 18.92,11.46 18.92,13.11 17.02,15.01 15.49,15.01 15.41,15.1
$1N34942 on Top Layer: 14.22,17.05 14.99,17.05 14.99,13.36 14.22,13.36
$1N34942 on Bottom Layer: 13.72,17.05 15.37,17.05 15.37,12.09 13.72,12.09
$1N34942 on Bottom Layer: 7.36,12.83 15.37,12.83 15.37,-0.86 7.36,-0.86
$1N34952 on Top Layer: 7.7,15.22 11.3,15.22 11.3,13.62 7.7,13.62
$1N34952 on Top Layer: 10.54,16.67 11.99,16.67 11.99,14.91 10.54,14.91
$1N34960 on Top Layer: 12.57,17.05 13.43,17.05 13.43,13.28 12.57,13.28
$1N34960 on Bottom Layer: 3.43,17.3 13.43,17.3 13.43,13.15 3.43,13.15
$1N34960 on Bottom Layer: -0.13,13.74 6.22,13.74 6.22,-0.48 -0.13,-0.48

## Text on the board
Bottom Silkscreen Layer: Designed by iam大头
Top Silkscreen Layer: - | +
